# Altium project NEXUS32.PrjPcb (part 2 of 2)

## Sheet 01_INPUT_POWER.SchDoc
size A3
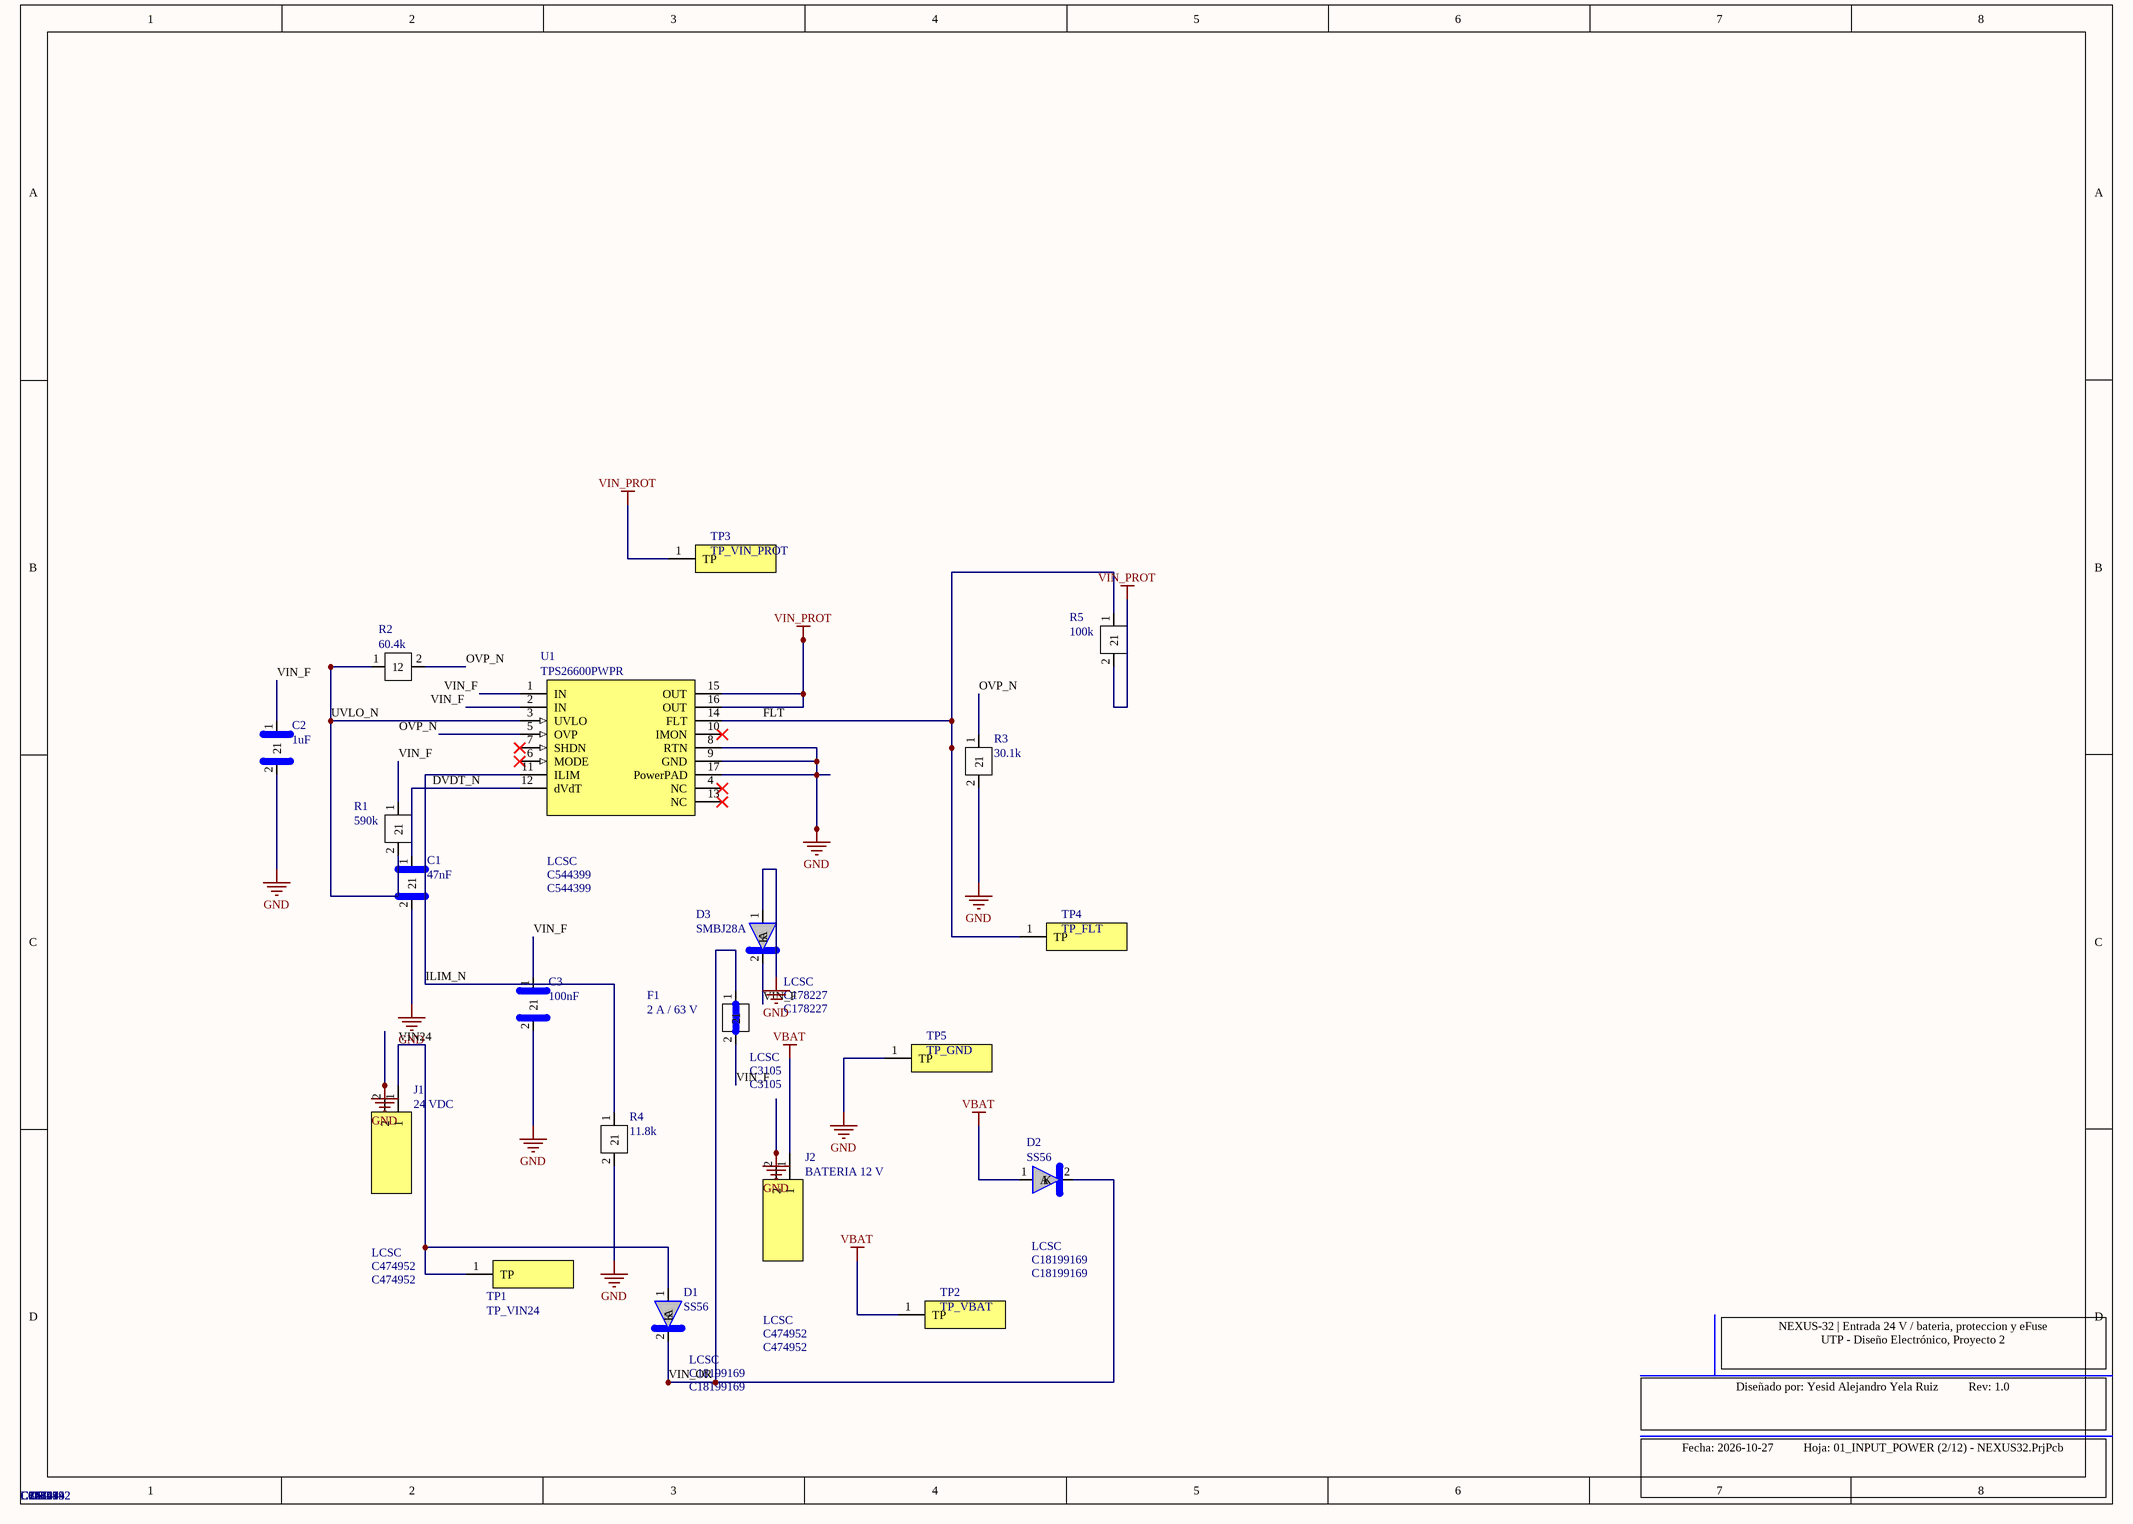
[diagram p10: 01_INPUT_POWER.SchDoc]

### Parts
C1  47nF  Supplier 1: LCSC  Supplier Part Number 1: C1622  [R_0603]
C2  1uF  Supplier 1: LCSC  Supplier Part Number 1: C15849  [R_0603]
C3  100nF  Supplier 1: LCSC  Supplier Part Number 1: C14663  [R_0603]
D1  SS56  Supplier 1: LCSC  Supplier Part Number 1: C18199169  [D_SMA]
D2  SS56  Supplier 1: LCSC  Supplier Part Number 1: C18199169  [D_SMA]
D3  SMBJ28A  Supplier 1: LCSC  Supplier Part Number 1: C178227  [D_SMB]
F1  2 A / 63 V  Supplier 1: LCSC  Supplier Part Number 1: C3105  [F_1206]
J1  24 VDC  Supplier 1: LCSC  Supplier Part Number 1: C474952  [TB_KF128-5.08-2P]
J2  BATERIA 12 V  Supplier 1: LCSC  Supplier Part Number 1: C474952  [TB_KF128-5.08-2P]
R1  590k  Supplier 1: LCSC  Supplier Part Number 1: C861479  [R_0603]
R2  60.4k  Supplier 1: LCSC  Supplier Part Number 1: C862235  [R_0603]
R3  30.1k  Supplier 1: LCSC  Supplier Part Number 1: C2989442  [R_0603]
R4  11.8k  Supplier 1: LCSC  Supplier Part Number 1: C22861  [R_0603]
R5  100k  Supplier 1: LCSC  Supplier Part Number 1: C25803  [R_0603]
TP1  TP_VIN24  [TP_PAD_1.5mm]
TP2  TP_VBAT  [TP_PAD_1.5mm]
TP3  TP_VIN_PROT  [TP_PAD_1.5mm]
TP4  TP_FLT  [TP_PAD_1.5mm]
TP5  TP_GND  [TP_PAD_1.5mm]
U1  TPS26600PWPR  Supplier 1: LCSC  Supplier Part Number 1: C544399  [HTSSOP-16-EP_PWP_P0.65]

### Nets
GND: C1.2 C2.2 C3.2 D3.1(A) J1.2 J2.2 R3.2 R4.2 TP5.1(TP) U1.8(RTN) U1.9(GND) U1.17(PowerPAD)
VBAT: D2.1(A) J2.1 TP2.1(TP)
VIN_PROT: R5.2 TP3.1(TP) U1.15(OUT) U1.16(OUT)
DVDT_N: C1.1 U1.12(dVdT)
FLT: R5.1 TP4.1(TP) U1.14(FLT)
ILIM_N: R4.1 U1.11(ILIM)
OVP_N: R2.2 R3.1 U1.5(OVP)
UVLO_N: R1.2 R2.1 U1.3(UVLO)
VIN24: D1.1(A) J1.1 TP1.1(TP)
VIN_F: C2.1 C3.1 D3.2(K) F1.2 R1.1 U1.1(IN) U1.2(IN)
VIN_OR: D1.2(K) D2.2(K) F1.1

Not connected (* = marked no-connect by the designer): U1 4(NC)* 6(MODE)* 7(SHDN)* 10(IMON)* 13(NC)*

### Notes on the sheet
- NEXUS-32 | Entrada 24 V / bateria, proteccion y eFuse
  UTP - Diseño Electrónico, Proyecto 2
- Diseñado por: Yesid Alejandro Yela Ruiz          Rev: 1.0
- Fecha: 2026-10-27          Hoja: 01_INPUT_POWER (2/12) - NEXUS32.PrjPcb

### Library data of the parts
C1 = CAP_0603: Condensador ceramico SMD 0603; Manufacturer: Samsung; Manufacturer Part Number: CL10B473KB8NNNC; Datasheet: https://wmsc.lcsc.com/wmsc/upload/file/pdf/v2/lcsc/2206010045_UNI-ROYAL-Uniroyal-Elec-0603WAF1002T5E_C25804.pdf; LCSC Part #: C1622
C2 = CAP_0603: Condensador ceramico SMD 0603; Manufacturer: Samsung; Manufacturer Part Number: CL10A105KB8NNNC; Datasheet: https://wmsc.lcsc.com/wmsc/upload/file/pdf/v2/lcsc/2206010045_UNI-ROYAL-Uniroyal-Elec-0603WAF1002T5E_C25804.pdf; LCSC Part #: C15849
C3 = CAP_0603: Condensador ceramico SMD 0603; Manufacturer: YAGEO; Manufacturer Part Number: CC0603KRX7R9BB104; Datasheet: https://wmsc.lcsc.com/wmsc/upload/file/pdf/v2/lcsc/2206010045_UNI-ROYAL-Uniroyal-Elec-0603WAF1002T5E_C25804.pdf; LCSC Part #: C14663
D1 D2 = SS56: Diodo Schottky 40V 5A SMA (MDD SS54); Manufacturer: hongjiacheng; Manufacturer Part Number: SS56; LCSC Part #: C18199169; Datasheet: https://wmsc.lcsc.com/wmsc/upload/file/pdf/v2/lcsc/2407101107_MDD-Microdiode-Semiconductor-SS54_C22452.pdf
D3 = SMBJ28A: TVS unidireccional 28V 600W SMB (Littelfuse SMBJ28A); Manufacturer: Littelfuse; Manufacturer Part Number: SMBJ28A; LCSC Part #: C178227; Datasheet: https://wmsc.lcsc.com/wmsc/upload/file/pdf/v2/lcsc/2304140030_Littelfuse-SMBJ28A_C178227.pdf
F1 = FUSE_1206: Fusible SMD 1206 2A 63V (Littelfuse 0466002.NRHF); Manufacturer: Littelfuse; Manufacturer Part Number: 0466002.NRHF; LCSC Part #: C3105; Datasheet: https://wmsc.lcsc.com/wmsc/upload/file/pdf/v2/lcsc/1810111920_Littelfuse-0466002-NRHF_C3105.pdf
J1 J2 = KF128-5.08-2P-AA: Bornera tornillo 2 polos paso 5.08mm (Cixi Kefa KF128-5.08-2P-AA); Manufacturer: Cixi Kefa Electronics (KEFA); Manufacturer Part Number: KF128-5.08-2P-AA; LCSC Part #: C474952; Datasheet: https://wmsc.lcsc.com/wmsc/upload/file/pdf/v2/lcsc/2408211511_Cixi-Kefa-Elec-KF128-5-08-2P-AA_C474952.pdf
R1 = RES_0603: Resistencia SMD 0603; Manufacturer: YAGEO; Manufacturer Part Number: RT0603BRD07590KL; Datasheet: https://wmsc.lcsc.com/wmsc/upload/file/pdf/v2/lcsc/2206010045_UNI-ROYAL-Uniroyal-Elec-0603WAF1002T5E_C25804.pdf; LCSC Part #: C861479
R2 = RES_0603: Resistencia SMD 0603; Manufacturer: YAGEO; Manufacturer Part Number: RT0603BRE0760K4L; Datasheet: https://wmsc.lcsc.com/wmsc/upload/file/pdf/v2/lcsc/2206010045_UNI-ROYAL-Uniroyal-Elec-0603WAF1002T5E_C25804.pdf; LCSC Part #: C862235
R3 = RES_0603: Resistencia SMD 0603; Manufacturer: UNI-ROYAL; Manufacturer Part Number: TC0325B3012T5F; Datasheet: https://wmsc.lcsc.com/wmsc/upload/file/pdf/v2/lcsc/2206010045_UNI-ROYAL-Uniroyal-Elec-0603WAF1002T5E_C25804.pdf; LCSC Part #: C2989442
R4 = RES_0603: Resistencia SMD 0603; Manufacturer: UNI-ROYAL; Manufacturer Part Number: 0603WAF1182T5E; Datasheet: https://wmsc.lcsc.com/wmsc/upload/file/pdf/v2/lcsc/2206010045_UNI-ROYAL-Uniroyal-Elec-0603WAF1002T5E_C25804.pdf; LCSC Part #: C22861
R5 = RES_0603: Resistencia SMD 0603; Manufacturer: UNI-ROYAL; Manufacturer Part Number: 0603WAF1003T5E; Datasheet: https://wmsc.lcsc.com/wmsc/upload/file/pdf/v2/lcsc/2206010045_UNI-ROYAL-Uniroyal-Elec-0603WAF1002T5E_C25804.pdf; LCSC Part #: C25803
TP1-TP5 = TESTPOINT: Punto de prueba, pad desnudo de 1.5mm sin montaje; Manufacturer: n/a; Manufacturer Part Number: TP_PAD_1.5mm; Datasheet: https://wmsc.lcsc.com/wmsc/upload/file/pdf/v2/lcsc/2206010045_UNI-ROYAL-Uniroyal-Elec-0603WAF1002T5E_C25804.pdf
U1 = TPS26600PWPR: eFuse 4.2-60V, OVP/UVLO ajustables, HTSSOP-16 PowerPAD (TI TPS26600PWPR); Manufacturer: Texas Instruments; Manufacturer Part Number: TPS26600PWPR; LCSC Part #: C544399; Datasheet: https://wmsc.lcsc.com/wmsc/upload/file/pdf/v2/lcsc/2007161516_Texas-Instruments-TPS26600PWPR_C544399.pdf

## Sheet 02_POWER_REGULATION.SchDoc
size A3
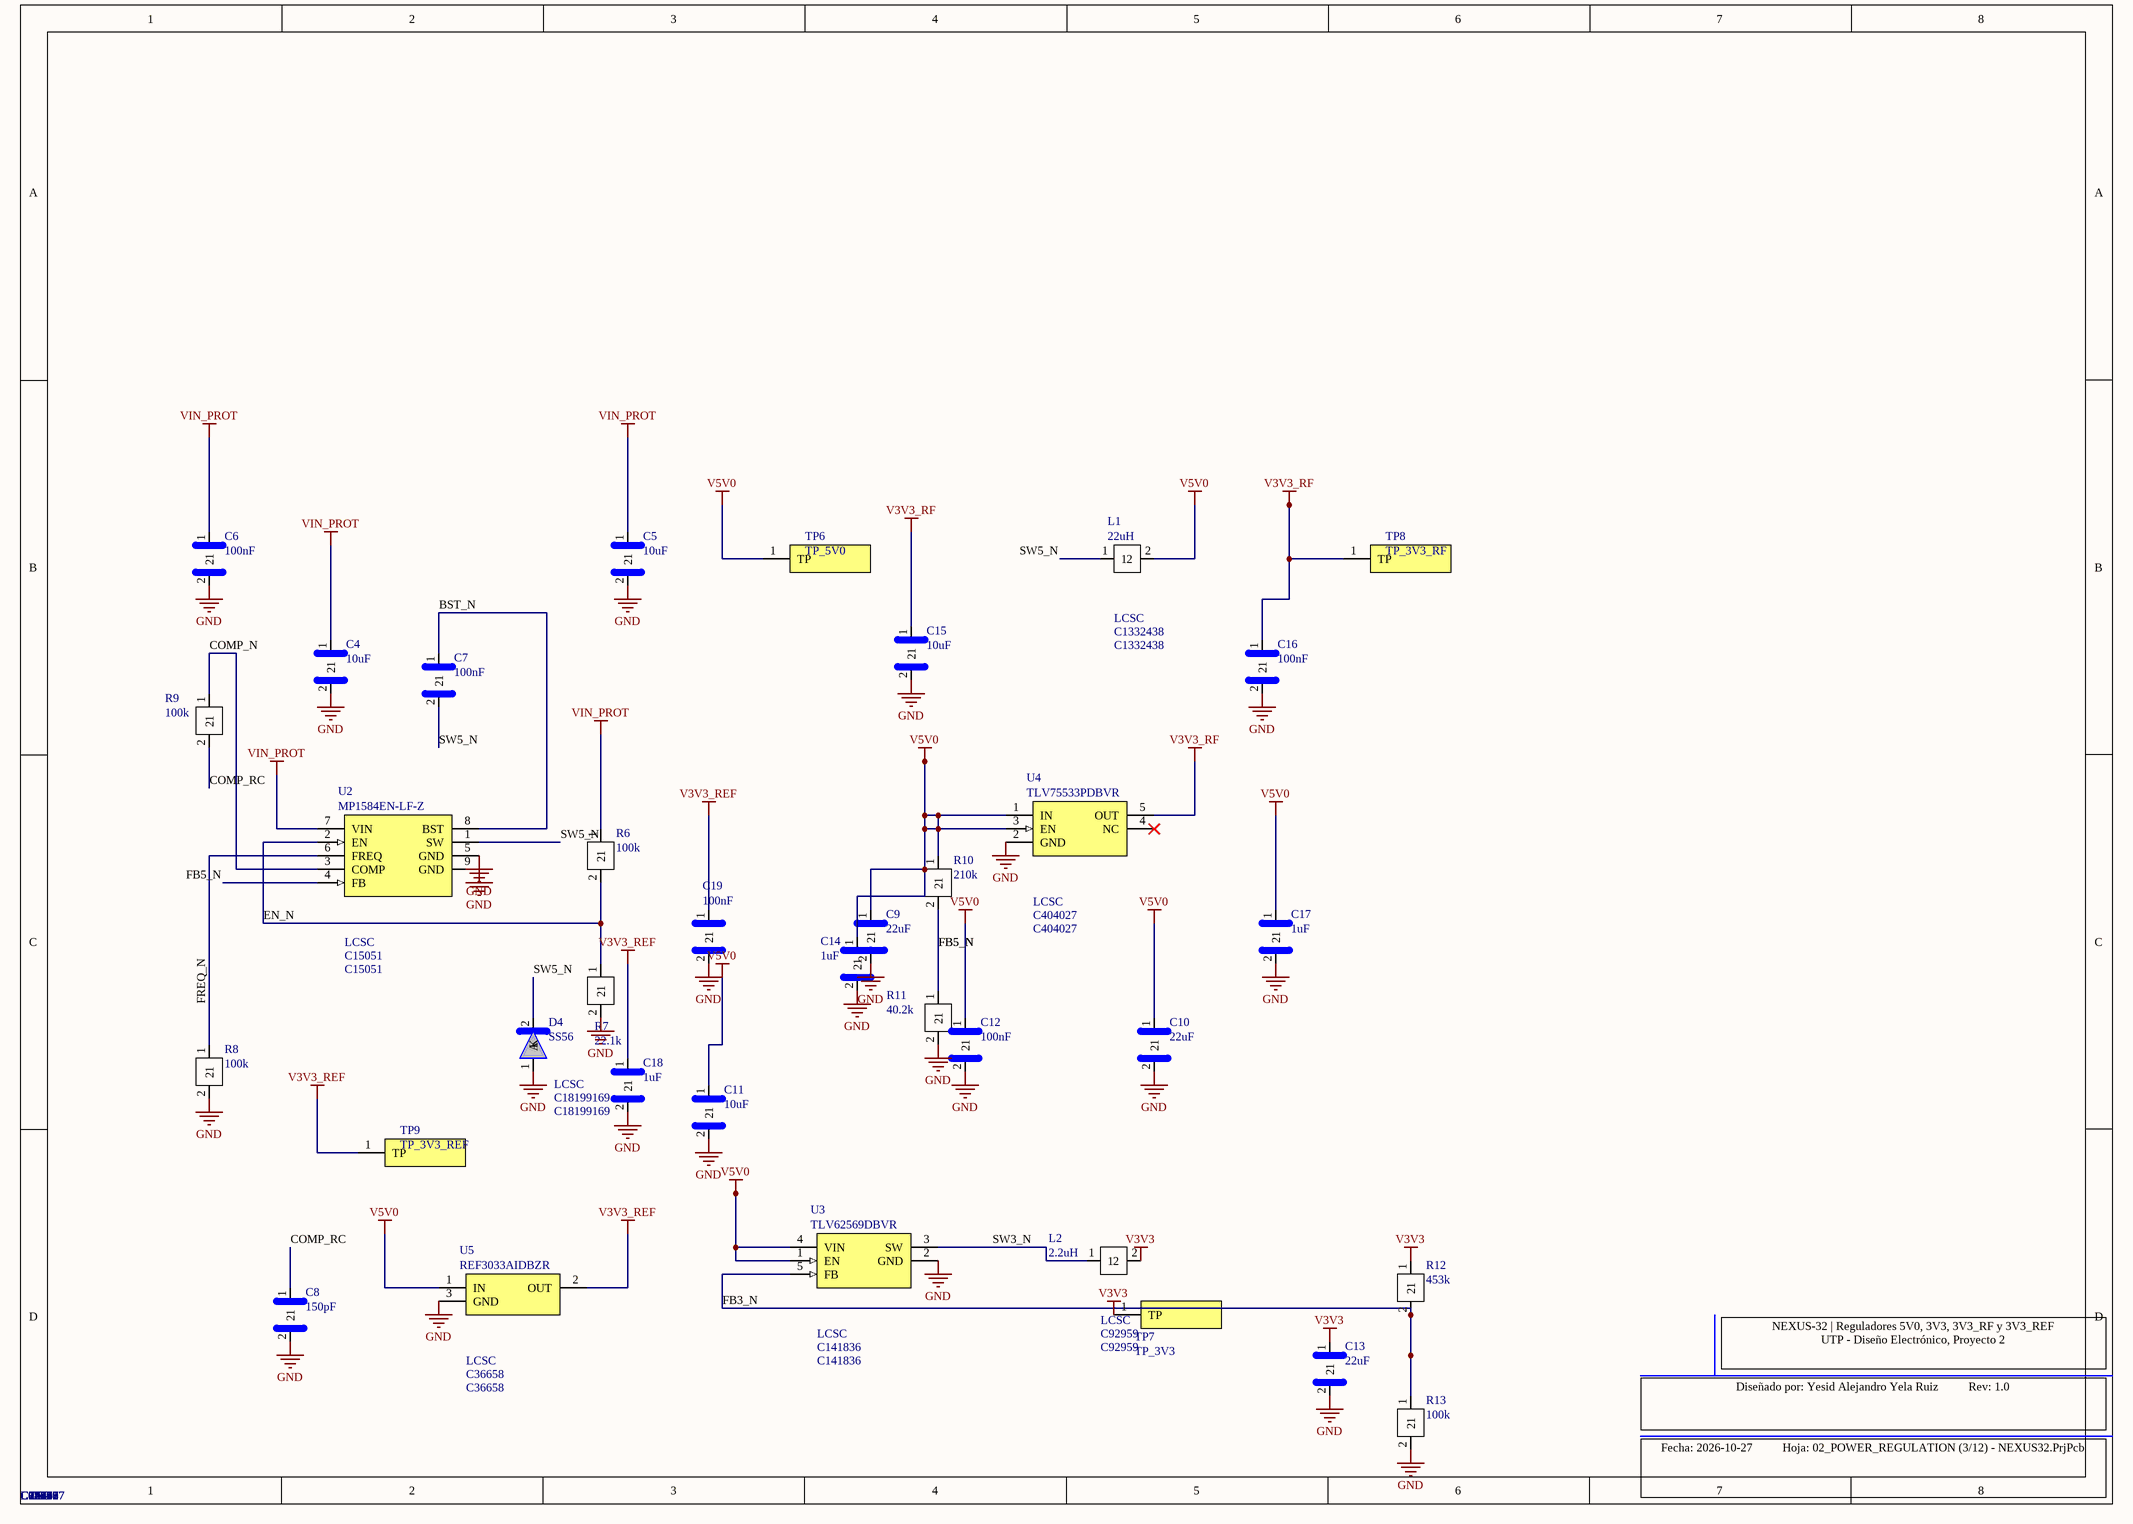
[diagram p11: 02_POWER_REGULATION.SchDoc]

### Parts
C4  10uF  Supplier 1: LCSC  Supplier Part Number 1: C138687  [C_1210]
C5  10uF  Supplier 1: LCSC  Supplier Part Number 1: C138687  [C_1210]
C6  100nF  Supplier 1: LCSC  Supplier Part Number 1: C14663  [R_0603]
C7  100nF  Supplier 1: LCSC  Supplier Part Number 1: C14663  [R_0603]
C8  150pF  Supplier 1: LCSC  Supplier Part Number 1: C37298  [R_0603]
C9  22uF  Supplier 1: LCSC  Supplier Part Number 1: C98190  [C_0805]
C10  22uF  Supplier 1: LCSC  Supplier Part Number 1: C98190  [C_0805]
C11  10uF  Supplier 1: LCSC  Supplier Part Number 1: C1713  [C_0805]
C12  100nF  Supplier 1: LCSC  Supplier Part Number 1: C14663  [R_0603]
C13  22uF  Supplier 1: LCSC  Supplier Part Number 1: C29277  [C_0805]
C14  1uF  Supplier 1: LCSC  Supplier Part Number 1: C15849  [R_0603]
C15  10uF  Supplier 1: LCSC  Supplier Part Number 1: C19702  [R_0603]
C16  100nF  Supplier 1: LCSC  Supplier Part Number 1: C14663  [R_0603]
C17  1uF  Supplier 1: LCSC  Supplier Part Number 1: C15849  [R_0603]
C18  1uF  Supplier 1: LCSC  Supplier Part Number 1: C15849  [R_0603]
C19  100nF  Supplier 1: LCSC  Supplier Part Number 1: C14663  [R_0603]
D4  SS56  Supplier 1: LCSC  Supplier Part Number 1: C18199169  [D_SMA]
L1  22uH  Supplier 1: LCSC  Supplier Part Number 1: C1332438  [L_SRP7050TA]
L2  2.2uH  Supplier 1: LCSC  Supplier Part Number 1: C92959  [L_NRS4018]
R6  100k  Supplier 1: LCSC  Supplier Part Number 1: C25803  [R_0603]
R7  22.1k  Supplier 1: LCSC  Supplier Part Number 1: C25961  [R_0603]
R8  100k  Supplier 1: LCSC  Supplier Part Number 1: C25803  [R_0603]
R9  100k  Supplier 1: LCSC  Supplier Part Number 1: C25803  [R_0603]
R10  210k  Supplier 1: LCSC  Supplier Part Number 1: C22952  [R_0603]
R11  40.2k  Supplier 1: LCSC  Supplier Part Number 1: C12447  [R_0603]
R12  453k  Supplier 1: LCSC  Supplier Part Number 1: C25818  [R_0603]
R13  100k  Supplier 1: LCSC  Supplier Part Number 1: C25803  [R_0603]
TP6  TP_5V0  [TP_PAD_1.5mm]
TP7  TP_3V3  [TP_PAD_1.5mm]
TP8  TP_3V3_RF  [TP_PAD_1.5mm]
TP9  TP_3V3_REF  [TP_PAD_1.5mm]
U2  MP1584EN-LF-Z  Supplier 1: LCSC  Supplier Part Number 1: C15051  [SOIC-8-EP_MP1584]
U3  TLV62569DBVR  Supplier 1: LCSC  Supplier Part Number 1: C141836  [SOT-23-5_DBV]
U4  TLV75533PDBVR  Supplier 1: LCSC  Supplier Part Number 1: C404027  [SOT-23-5_DBV]
U5  REF3033AIDBZR  Supplier 1: LCSC  Supplier Part Number 1: C36658  [SOT-23-3_DBZ]

### Nets
GND: C4.2 C5.2 C6.2 C8.2 C9.2 C10.2 C11.2 C12.2 C13.2 C14.2 C15.2 C16.2 C17.2 C18.2 C19.2 D4.1(A) R7.2 R8.2 R11.2 R13.2 U2.5(GND) U2.9(GND) U3.2(GND) U4.2(GND) U5.3(GND)
V3V3: C13.1 L2.2 R12.1 TP7.1(TP)
V3V3_REF: C18.1 C19.1 TP9.1(TP) U5.2(OUT)
V3V3_RF: C15.1 C16.1 TP8.1(TP) U4.5(OUT)
V5V0: C9.1 C10.1 C11.1 C12.1 C14.1 C17.1 L1.2 R10.1 TP6.1(TP) U3.1(EN) U3.4(VIN) U4.1(IN) U4.3(EN) U5.1(IN)
VIN_PROT: C4.1 C5.1 C6.1 R6.1 U2.7(VIN)
BST_N: C7.1 U2.8(BST)
COMP_N: R9.1 U2.3(COMP)
COMP_RC: C8.1 R9.2
EN_N: R6.2 R7.1 U2.2(EN)
FB3_N: R12.2 R13.1 U3.5(FB)
FB5_N: R10.2 R11.1 U2.4(FB)
FREQ_N: R8.1 U2.6(FREQ)
SW3_N: L2.1 U3.3(SW)
SW5_N: C7.2 D4.2(K) L1.1 U2.1(SW)

Not connected (* = marked no-connect by the designer): U4 4(NC)*

### Notes on the sheet
- NEXUS-32 | Reguladores 5V0, 3V3, 3V3_RF y 3V3_REF
  UTP - Diseño Electrónico, Proyecto 2
- Diseñado por: Yesid Alejandro Yela Ruiz          Rev: 1.0
- Fecha: 2026-10-27          Hoja: 02_POWER_REGULATION (3/12) - NEXUS32.PrjPcb

### Library data of the parts
C4 C5 = CAP_1210: Condensador ceramico SMD 1210; Manufacturer: Samsung; Manufacturer Part Number: CL32B106KBJNNNE; Datasheet: https://wmsc.lcsc.com/wmsc/upload/file/pdf/v2/lcsc/2206010045_UNI-ROYAL-Uniroyal-Elec-0603WAF1002T5E_C25804.pdf; LCSC Part #: C138687
C6 C7 C12 C16 C19 = CAP_0603: as C3 on sheet 01_INPUT_POWER; Datasheet: https://wmsc.lcsc.com/wmsc/upload/file/pdf/v2/lcsc/2206010045_UNI-ROYAL-Uniroyal-Elec-0603WAF1002T5E_C25804.pdf; LCSC Part #: C14663
C8 = CAP_0603: Condensador ceramico SMD 0603; Manufacturer: Samsung; Manufacturer Part Number: CL10C151JB8NNNC; Datasheet: https://wmsc.lcsc.com/wmsc/upload/file/pdf/v2/lcsc/2206010045_UNI-ROYAL-Uniroyal-Elec-0603WAF1002T5E_C25804.pdf; LCSC Part #: C37298
C9 C10 = CAP_0805: Condensador ceramico SMD 0805; Manufacturer: Samsung; Manufacturer Part Number: CL21A226MOQNNNE; Datasheet: https://wmsc.lcsc.com/wmsc/upload/file/pdf/v2/lcsc/2206010045_UNI-ROYAL-Uniroyal-Elec-0603WAF1002T5E_C25804.pdf; LCSC Part #: C98190
C11 = CAP_0805: Condensador ceramico SMD 0603; Manufacturer: Samsung; Manufacturer Part Number: CL21A106KOQNNNE; Datasheet: https://wmsc.lcsc.com/wmsc/upload/file/pdf/v2/lcsc/2206010045_UNI-ROYAL-Uniroyal-Elec-0603WAF1002T5E_C25804.pdf; LCSC Part #: C1713
C13 = CAP_0805: Condensador ceramico SMD 0805; Manufacturer: Samsung; Manufacturer Part Number: CL21A226MPQNNNE; Datasheet: https://wmsc.lcsc.com/wmsc/upload/file/pdf/v2/lcsc/2206010045_UNI-ROYAL-Uniroyal-Elec-0603WAF1002T5E_C25804.pdf; LCSC Part #: C29277
C14 C17 C18 = CAP_0603: as C2 on sheet 01_INPUT_POWER; Datasheet: https://wmsc.lcsc.com/wmsc/upload/file/pdf/v2/lcsc/2206010045_UNI-ROYAL-Uniroyal-Elec-0603WAF1002T5E_C25804.pdf; LCSC Part #: C15849
C15 = CAP_0603: Condensador ceramico SMD 0603; Manufacturer: Samsung; Manufacturer Part Number: CL10A106KP8NNNC; Datasheet: https://wmsc.lcsc.com/wmsc/upload/file/pdf/v2/lcsc/2206010045_UNI-ROYAL-Uniroyal-Elec-0603WAF1002T5E_C25804.pdf; LCSC Part #: C19702
D4 = SS56: as D1 on sheet 01_INPUT_POWER; Manufacturer Part Number: SS56; LCSC Part #: C18199169; Datasheet: https://wmsc.lcsc.com/wmsc/upload/file/pdf/v2/lcsc/2407101107_MDD-Microdiode-Semiconductor-SS54_C22452.pdf
L1 = IND_SRP7050TA: Inductor de potencia 22uH 7.3x6.6mm (Bourns SRP7050TA-220M); Manufacturer: Bourns; Manufacturer Part Number: SRP7050TA-220M; LCSC Part #: C1332438; Datasheet: https://wmsc.lcsc.com/wmsc/upload/file/pdf/v2/lcsc/2304140030_BOURNS-SRP7050TA-220M_C1332438.pdf
L2 = IND_NRS4018: Inductor de potencia 2.2uH 4x4mm (Taiyo Yuden NRS4018T2R2MDGJ); Manufacturer: Taiyo Yuden; Manufacturer Part Number: NRS4018T2R2MDGJ; LCSC Part #: C92959; Datasheet: https://wmsc.lcsc.com/wmsc/upload/file/pdf/v2/lcsc/2211282300_Taiyo-Yuden-NRS4018T2R2MDGJ_C92959.pdf
R6 R8 R9 R13 = RES_0603: as R5 on sheet 01_INPUT_POWER; Datasheet: https://wmsc.lcsc.com/wmsc/upload/file/pdf/v2/lcsc/2206010045_UNI-ROYAL-Uniroyal-Elec-0603WAF1002T5E_C25804.pdf; LCSC Part #: C25803
R7 = RES_0603: Resistencia SMD 0603; Manufacturer: UNI-ROYAL; Manufacturer Part Number: 0603WAF2212T5E; Datasheet: https://wmsc.lcsc.com/wmsc/upload/file/pdf/v2/lcsc/2206010045_UNI-ROYAL-Uniroyal-Elec-0603WAF1002T5E_C25804.pdf; LCSC Part #: C25961
R10 = RES_0603: Resistencia SMD 0603; Manufacturer: UNI-ROYAL; Manufacturer Part Number: 0603WAF2103T5E; Datasheet: https://wmsc.lcsc.com/wmsc/upload/file/pdf/v2/lcsc/2206010045_UNI-ROYAL-Uniroyal-Elec-0603WAF1002T5E_C25804.pdf; LCSC Part #: C22952
R11 = RES_0603: Resistencia SMD 0603; Manufacturer: UNI-ROYAL; Manufacturer Part Number: 0603WAF4022T5E; Datasheet: https://wmsc.lcsc.com/wmsc/upload/file/pdf/v2/lcsc/2206010045_UNI-ROYAL-Uniroyal-Elec-0603WAF1002T5E_C25804.pdf; LCSC Part #: C12447
R12 = RES_0603: Resistencia SMD 0603; Manufacturer: UNI-ROYAL; Manufacturer Part Number: 0603WAF4533T5E; Datasheet: https://wmsc.lcsc.com/wmsc/upload/file/pdf/v2/lcsc/2206010045_UNI-ROYAL-Uniroyal-Elec-0603WAF1002T5E_C25804.pdf; LCSC Part #: C25818
TP6-TP9 = TESTPOINT: as TP1 on sheet 01_INPUT_POWER; Manufacturer: n/a; Manufacturer Part Number: TP_PAD_1.5mm; Datasheet: https://wmsc.lcsc.com/wmsc/upload/file/pdf/v2/lcsc/2206010045_UNI-ROYAL-Uniroyal-Elec-0603WAF1002T5E_C25804.pdf
U2 = MP1584EN-LF-Z: Reductor 3A 28V 1.5MHz SOIC8E con pad expuesto (MPS MP1584EN-LF-Z); Manufacturer: Monolithic Power Systems; Manufacturer Part Number: MP1584EN-LF-Z; LCSC Part #: C15051; Datasheet: https://wmsc.lcsc.com/wmsc/upload/file/pdf/v2/lcsc/2401301656_Monolithic-Power-Systems-MP1584EN-LF-P_C7304223.pdf
U3 = TLV62569DBVR: Reductor sincrono 2A 2.5-5.5V SOT-23-5 (TI TLV62569DBVR); Manufacturer: Texas Instruments; Manufacturer Part Number: TLV62569DBVR; LCSC Part #: C141836; Datasheet: https://www.ti.com/lit/ds/symlink/tlv62569.pdf
U4 = TLV75533PDBVR: LDO 500mA 3.3V SOT-23-5 (TI TLV75533PDBVR); Manufacturer: Texas Instruments; Manufacturer Part Number: TLV75533PDBVR; LCSC Part #: C404027; Datasheet: https://wmsc.lcsc.com/wmsc/upload/file/pdf/v2/lcsc/1912111437_Texas-Instruments-TLV75533PDBVR_C404027.pdf
U5 = REF3033AIDBZR: Referencia de tension 3.3V 0.2% SOT-23-3 (TI REF3033AIDBZR); Manufacturer: Texas Instruments; Manufacturer Part Number: REF3033AIDBZR; LCSC Part #: C36658; Datasheet: https://wmsc.lcsc.com/wmsc/upload/file/pdf/v2/lcsc/2304140030_Texas-Instruments-REF3033AIDBZR_C36658.pdf

## Nets that join several sheets
GND: 03_ESP32_CORE (11 pins), 04_I2C_EEPROM (6 pins), 05_I2C_RTC (BT1.2 C25.2 U8.4), 06_I2C_OLED (7 pins), 10_UART_USB (13 pins), 07_SPI_ADC (31 pins), 08_SPI_ETHERNET (21 pins), 09_SPI_LORA (8 pins), 11_DIGITAL_OUTPUTS (10 pins), 01_INPUT_POWER (12 pins), 02_POWER_REGULATION (25 pins)
V3V3: 03_ESP32_CORE (13 pins), 04_I2C_EEPROM (C24.1 U7.8), 05_I2C_RTC (R25.1), 06_I2C_OLED (J3.2), 10_UART_USB (7 pins), 08_SPI_ETHERNET (13 pins), 02_POWER_REGULATION (C13.1 L2.2 R12.1 TP7.1)
V3V3_REF: 07_SPI_ADC (12 pins), 02_POWER_REGULATION (C18.1 C19.1 TP9.1 U5.2)
V3V3_RF: 09_SPI_LORA (C51.1 C52.1 C53.1 U13.3), 02_POWER_REGULATION (C15.1 C16.1 TP8.1 U4.5)
V5V0: 05_I2C_RTC (C25.1 U8.8), 07_SPI_ADC (C31.1 C32.1 U10.4 U11.4), 11_DIGITAL_OUTPUTS (9 pins), 02_POWER_REGULATION (14 pins)
VIN_PROT: 01_INPUT_POWER (R5.2 TP3.1 U1.15 U1.16), 02_POWER_REGULATION (5 pins)
BTN_DOWN: 03_ESP32_CORE (U6.13), 06_I2C_OLED (C27.1 SW4.1)
BTN_OK: 03_ESP32_CORE (U6.12), 06_I2C_OLED (C28.1 SW5.1)
BTN_UP: 03_ESP32_CORE (U6.16), 06_I2C_OLED (C26.1 SW3.1)
CS_ADC: 03_ESP32_CORE (R20.2 U6.28), 07_SPI_ADC (U9.10)
CS_ENC: 03_ESP32_CORE (R19.2 U6.29), 08_SPI_ETHERNET (U12.9)
CS_LORA: 03_ESP32_CORE (R21.2 U6.27), 09_SPI_LORA (U13.15)
DIO0: 03_ESP32_CORE (U6.7), 09_SPI_LORA (U13.5)
DIO1: 03_ESP32_CORE (U6.5), 09_SPI_LORA (U13.6)
EN: 03_ESP32_CORE (5 pins), 10_UART_USB (Q1.3)
INT_ENC: 03_ESP32_CORE (R23.2 U6.6), 08_SPI_ETHERNET (U12.4)
IO0: 03_ESP32_CORE (R15.2 SW2.1 TP11.1 U6.25), 10_UART_USB (Q2.3)
MISO: 03_ESP32_CORE (TP17.1 U6.31), 07_SPI_ADC (U9.12), 08_SPI_ETHERNET (U12.6), 09_SPI_LORA (U13.13)
MOSI: 03_ESP32_CORE (TP18.1 U6.37), 07_SPI_ADC (U9.11), 08_SPI_ETHERNET (U12.7), 09_SPI_LORA (U13.14)
RLY1: 03_ESP32_CORE (U6.10), 11_DIGITAL_OUTPUTS (R63.1 R64.1 TP22.1)
RLY2: 03_ESP32_CORE (U6.11), 11_DIGITAL_OUTPUTS (R68.1 R69.1 TP23.1)
RST_ENC: 03_ESP32_CORE (R22.2 U6.8), 08_SPI_ETHERNET (U12.10)
RST_LORA: 03_ESP32_CORE (U6.9), 09_SPI_LORA (U13.4)
RXD0: 03_ESP32_CORE (TP13.1 U6.34), 10_UART_USB (U14.26)
SCK: 03_ESP32_CORE (TP16.1 U6.30), 07_SPI_ADC (U9.13), 08_SPI_ETHERNET (U12.8), 09_SPI_LORA (U13.12)
SCL: 03_ESP32_CORE (R18.2 TP15.1 U6.36), 04_I2C_EEPROM (U7.6), 05_I2C_RTC (U8.6), 06_I2C_OLED (J3.3)
SDA: 03_ESP32_CORE (R17.2 TP14.1 U6.33), 04_I2C_EEPROM (U7.5), 05_I2C_RTC (U8.5), 06_I2C_OLED (J3.4)
SQW: 03_ESP32_CORE (U6.4), 05_I2C_RTC (R25.2 U8.7)
TXD0: 03_ESP32_CORE (R16.2 TP12.1), 10_UART_USB (U14.25)